# Altium schematic sheet Controller_Section_2.SchDoc
size A4; SheetNumber: 7
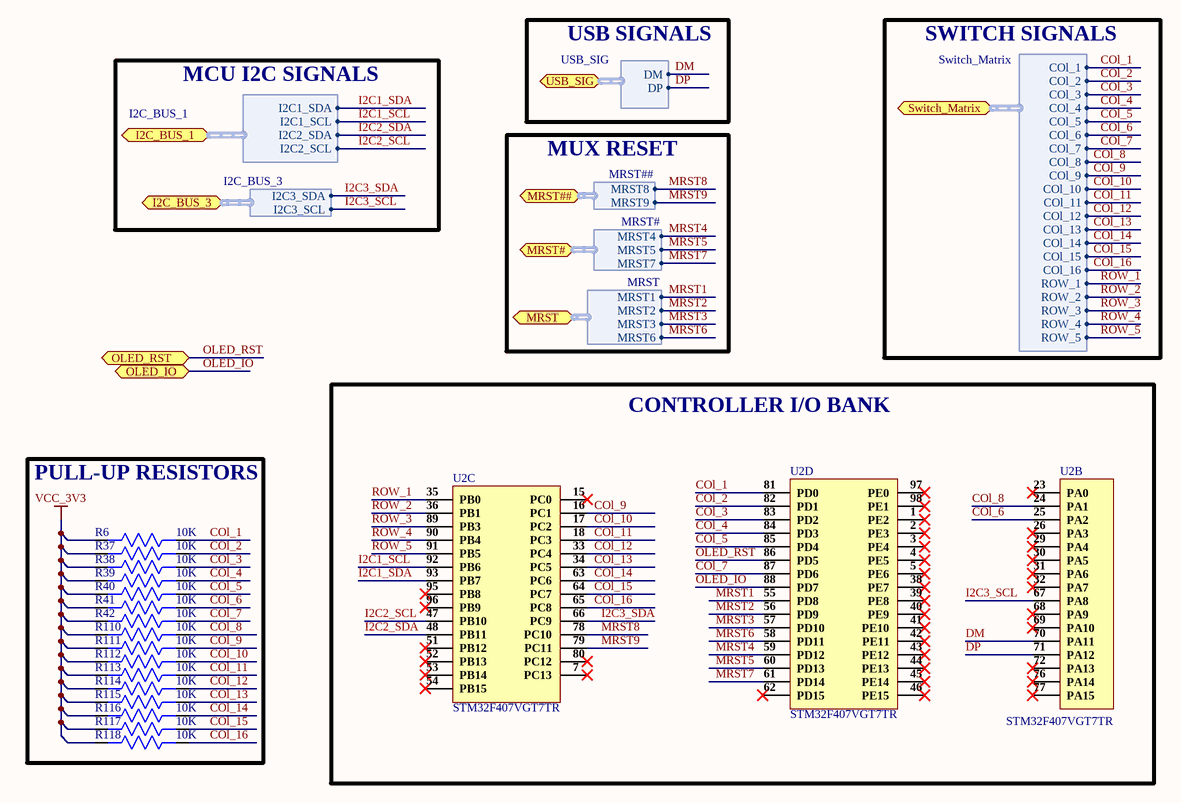
[diagram p0: Controller_Section_2.SchDoc]

## Parts
R6  10K  [Res0603]
R37  10K  [Res0603]
R38  10K  [Res0603]
R39  10K  [Res0603]
R40  10K  [Res0603]
R41  10K  [Res0603]
R42  10K  [Res0603]
R110  10K  [Res0603]
R111  10K  [Res0603]
R112  10K  [Res0603]
R113  10K  [Res0603]
R114  10K  [Res0603]
R115  10K  [Res0603]
R116  10K  [Res0603]
R117  10K  [Res0603]
R118  10K  [Res0603]
U2  STM32F407VGT7TR  [LQFP-100]  (parts B,C,D of 4)

## Blocks framed on the sheet
CONTROLLER I/O BANK: U2
PULL-UP RESISTORS: R6 R37-R42 R110-R118

## Ports
I2C_BUS_1 (bidir, harness I2C_BUS_1), I2C_BUS_3 (bidir, harness I2C_BUS_3), MRST (bidir, harness MRST), MRST# (bidir, harness MRST#), MRST## (bidir, harness MRST##), OLED_IO (bidir), OLED_RST (bidir), Switch_Matrix (bidir, harness Switch_Matrix), USB_SIG (bidir, harness USB_SIG)

## Harnesses
USB_SIG: DM, DP
I2C_BUS_1: I2C2_SDA, I2C1_SCL, I2C1_SDA, I2C2_SCL
I2C_BUS_3: I2C3_SDA, I2C3_SCL
Switch_Matrix: COl_1, COl_2, COl_3, COl_4, COl_5, COl_6, COl_7, ROW_1, ROW_2, ROW_3, ROW_4, ROW_5, COl_8, COl_9, COl_10, COl_11, COl_12, COl_13, COl_14, COl_15, COl_16
MRST##: MRST8, MRST9
MRST#: MRST4, MRST5, MRST7
MRST: MRST1, MRST2, MRST3, MRST6

## Nets
VCC_3V3: R6.2 R37.2 R38.2 R39.2 R40.2 R41.2 R42.2 R110.2 R111.2 R112.2 R113.2 R114.2 R115.2 R116.2 R117.2 R118.2
COl_1: R6.1 U2.81(PD0) ; port Switch_Matrix.COl_1
COl_2: R37.1 U2.82(PD1) ; port Switch_Matrix.COl_2
COl_3: R38.1 U2.83(PD2) ; port Switch_Matrix.COl_3
COl_4: R39.1 U2.84(PD3) ; port Switch_Matrix.COl_4
COl_5: R40.1 U2.85(PD4) ; port Switch_Matrix.COl_5
COl_6: R41.1 U2.25(PA2) ; port Switch_Matrix.COl_6
COl_7: R42.1 U2.87(PD6) ; port Switch_Matrix.COl_7
COl_8: R110.1 U2.24(PA1) ; port Switch_Matrix.COl_8
COl_9: R111.1 U2.16(PC1) ; port Switch_Matrix.COl_9
COl_10: R112.1 U2.17(PC2) ; port Switch_Matrix.COl_10
COl_11: R113.1 U2.18(PC3) ; port Switch_Matrix.COl_11
COl_12: R114.1 U2.33(PC4) ; port Switch_Matrix.COl_12
COl_13: R115.1 U2.34(PC5) ; port Switch_Matrix.COl_13
COl_14: R116.1 U2.63(PC6) ; port Switch_Matrix.COl_14
COl_15: R117.1 U2.64(PC7) ; port Switch_Matrix.COl_15
COl_16: R118.1 U2.65(PC8) ; port Switch_Matrix.COl_16
DM: U2.70(PA11) ; port USB_SIG.DM
DP: U2.71(PA12) ; port USB_SIG.DP
I2C1_SCL: U2.92(PB6) ; port I2C_BUS_1.I2C1_SCL
I2C1_SDA: U2.93(PB7) ; port I2C_BUS_1.I2C1_SDA
I2C2_SCL: U2.47(PB10) ; port I2C_BUS_1.I2C2_SCL
I2C2_SDA: U2.48(PB11) ; port I2C_BUS_1.I2C2_SDA
I2C3_SCL: U2.67(PA8) ; port I2C_BUS_3.I2C3_SCL
I2C3_SDA: U2.66(PC9) ; port I2C_BUS_3.I2C3_SDA
MRST1: U2.55(PD8) ; port MRST.MRST1
MRST2: U2.56(PD9) ; port MRST.MRST2
MRST3: U2.57(PD10) ; port MRST.MRST3
MRST4: U2.59(PD12) ; port MRST#.MRST4
MRST5: U2.60(PD13) ; port MRST#.MRST5
MRST6: U2.58(PD11) ; port MRST.MRST6
MRST7: U2.61(PD14) ; port MRST#.MRST7
MRST8: U2.78(PC10) ; port MRST##.MRST8
MRST9: U2.79(PC11) ; port MRST##.MRST9
OLED_IO: U2.88(PD7) ; port OLED_IO
OLED_RST: U2.86(PD5) ; port OLED_RST
ROW_1: U2.35(PB0) ; port Switch_Matrix.ROW_1
ROW_2: U2.36(PB1) ; port Switch_Matrix.ROW_2
ROW_3: U2.89(PB3) ; port Switch_Matrix.ROW_3
ROW_4: U2.90(PB4) ; port Switch_Matrix.ROW_4
ROW_5: U2.91(PB5) ; port Switch_Matrix.ROW_5

Not connected (* = marked no-connect by the designer): U2 1(PE2)* 2(PE3)* 3(PE4)* 4(PE5)* 5(PE6)* 7(PC13)* 15(PC0)* 23(PA0)* 26(PA3)* 29(PA4)* 30(PA5)* 31(PA6)* 32(PA7)* 38(PE7)* 39(PE8)* 40(PE9)* 41(PE10)* 42(PE11)* 43(PE12)* 44(PE13)* 45(PE14)* 46(PE15)* 51(PB12)* 52(PB13)* 53(PB14)* 54(PB15)* 62(PD15)* 68(PA9)* 69(PA10)* 72(PA13)* 76(PA14)* 77(PA15)* 80(PC12)* 95(PB8)* 96(PB9)* 97(PE0)* 98(PE1)*

## Notes on the sheet
- USB SIGNALS
- SWITCH SIGNALS
- MCU I2C SIGNALS
- MUX RESET
- 1
- Huzaifa Ali

## Library data of the parts
R6 R37-R42 R110-R118 = AC0603JR-0710KL: RES SMD 10K OHM 5% 1/10W 0603; Manufacturer: Yageo; Voltage Rating: 50V; Resistance: 10kR; Power Rating: 100mW; Temperature Coefficient: 100ppm/°C; Supplier 1: Future Electronics; Manufacturer Part Number: AC0603JR-0710KL; RoHS: Yes; Category: Chip SMD Resistors; Stock 1: 1533000; Pricing 1: 5000=0.00540 (USD); Case/Package: 0603; Case Code (Imperial): 0603; Case Code (Metric): 1608; Size Code: 0603; Min Operating Temperature: -55°C; Max Operating Temperature: 155°C; Packaging: Tape and Reel; Tolerance: 5%; Package Quantity: 1; Resistor Type: Thick Film; Termination: SMD/SMT; Number of Terminations: 2; Max Power Dissipation: 100mW; Features: Moisture Resistant,Automotive AEC-Q200,Anti-Sulfur; Series: AC; Construction: Rectangular; Length: 0.063inch; Width: 0.031inch; Height: 0.022inch; Depth: 0.8mm; Military Standard: Not; Lead Free: Lead Free; RoHS Compliant: Yes; ComponentLink1URL: https://datasheet.ciiva.com/5562/pyu-ac-51-rohs-l-2-5562553.pdf?src-supplier=Mouser; ComponentLink1Description: https://datasheet.ciiva.com/5562/pyu-ac-51-rohs-l-2-5562553.pdf?src-supplier=Mouser; Supplier Part Number 1: 1029044
U2 = STM32F407VGT7TR: IC MCU 32BIT 1MB FLASH 100LQFP; Manufacturer: STMicroelectronics; RAM Size: 196KB; Max Power Dissipation: 465mW; Interface: I2C,SPI,USB,CAN,Ethernet,IrDA,UART,USART,LIN,EBI/EMI,I2S; Number of I/Os: 82; Number of Timers/Counters: 14; Frequency: 168MHz; Oscillator Type: Internal; Data Bus Width: 32b; Watchdog Timer: Yes; Peripherals: Brown-out Detect/Reset,POR,PWM,WDT,DMA,LCD; Core Architecture: ARM; Supplier 1: Avnet; Manufacturer Part Number: STM32F407VGT7TR; RoHS: Yes; Category: Microcontrollers; Pricing 1: 1000=8.54203, 2000=8.32301, 4000=8.19785, 6000=8.07269, 8000=7.97882, 10000=7.82238, 100000=7.69722 (USD); Case/Package: LQFP; Number of Pins: 100; Min Operating Temperature: -40°C; Max Operating Temperature: 105°C; Packaging: Tape and Reel; Number of Programmable I/O: 82; Max Frequency: 168MHz; Memory Type: FLASH; Memory Size: 1MB; Radiation Hardening: No; RoHS Compliant: Yes; ComponentLink1URL: https://datasheet.ciiva.com/48494/dm00037051-48494023.pdf?src-supplier=Avnet; ComponentLink1Description: https://datasheet.ciiva.com/48494/dm00037051-48494023.pdf?src-supplier=Avnet; Supplier Part Number 1: STM32F407VGT7TR